# Altium schematic sheet ADC.SchDoc: 07 - Aquisicao do fotodetector e monitores
size A3; Project: CM5 Photonic Bias Controller; DocumentRev: R5; ProjectRev: R5; Version: Rev R6; SheetNumber: 8; SheetTotal: 17; Author: Carlos Renan; SCH_SCALE: N/A; Address1: UFCG; Address2: Referencia: VIRTUS CC; Address3: Campina Grande - PB; ProjectName: Controle automatico de BIAS para MZM/IQ - Projeto 3; DocumentName: ADC.SchDoc
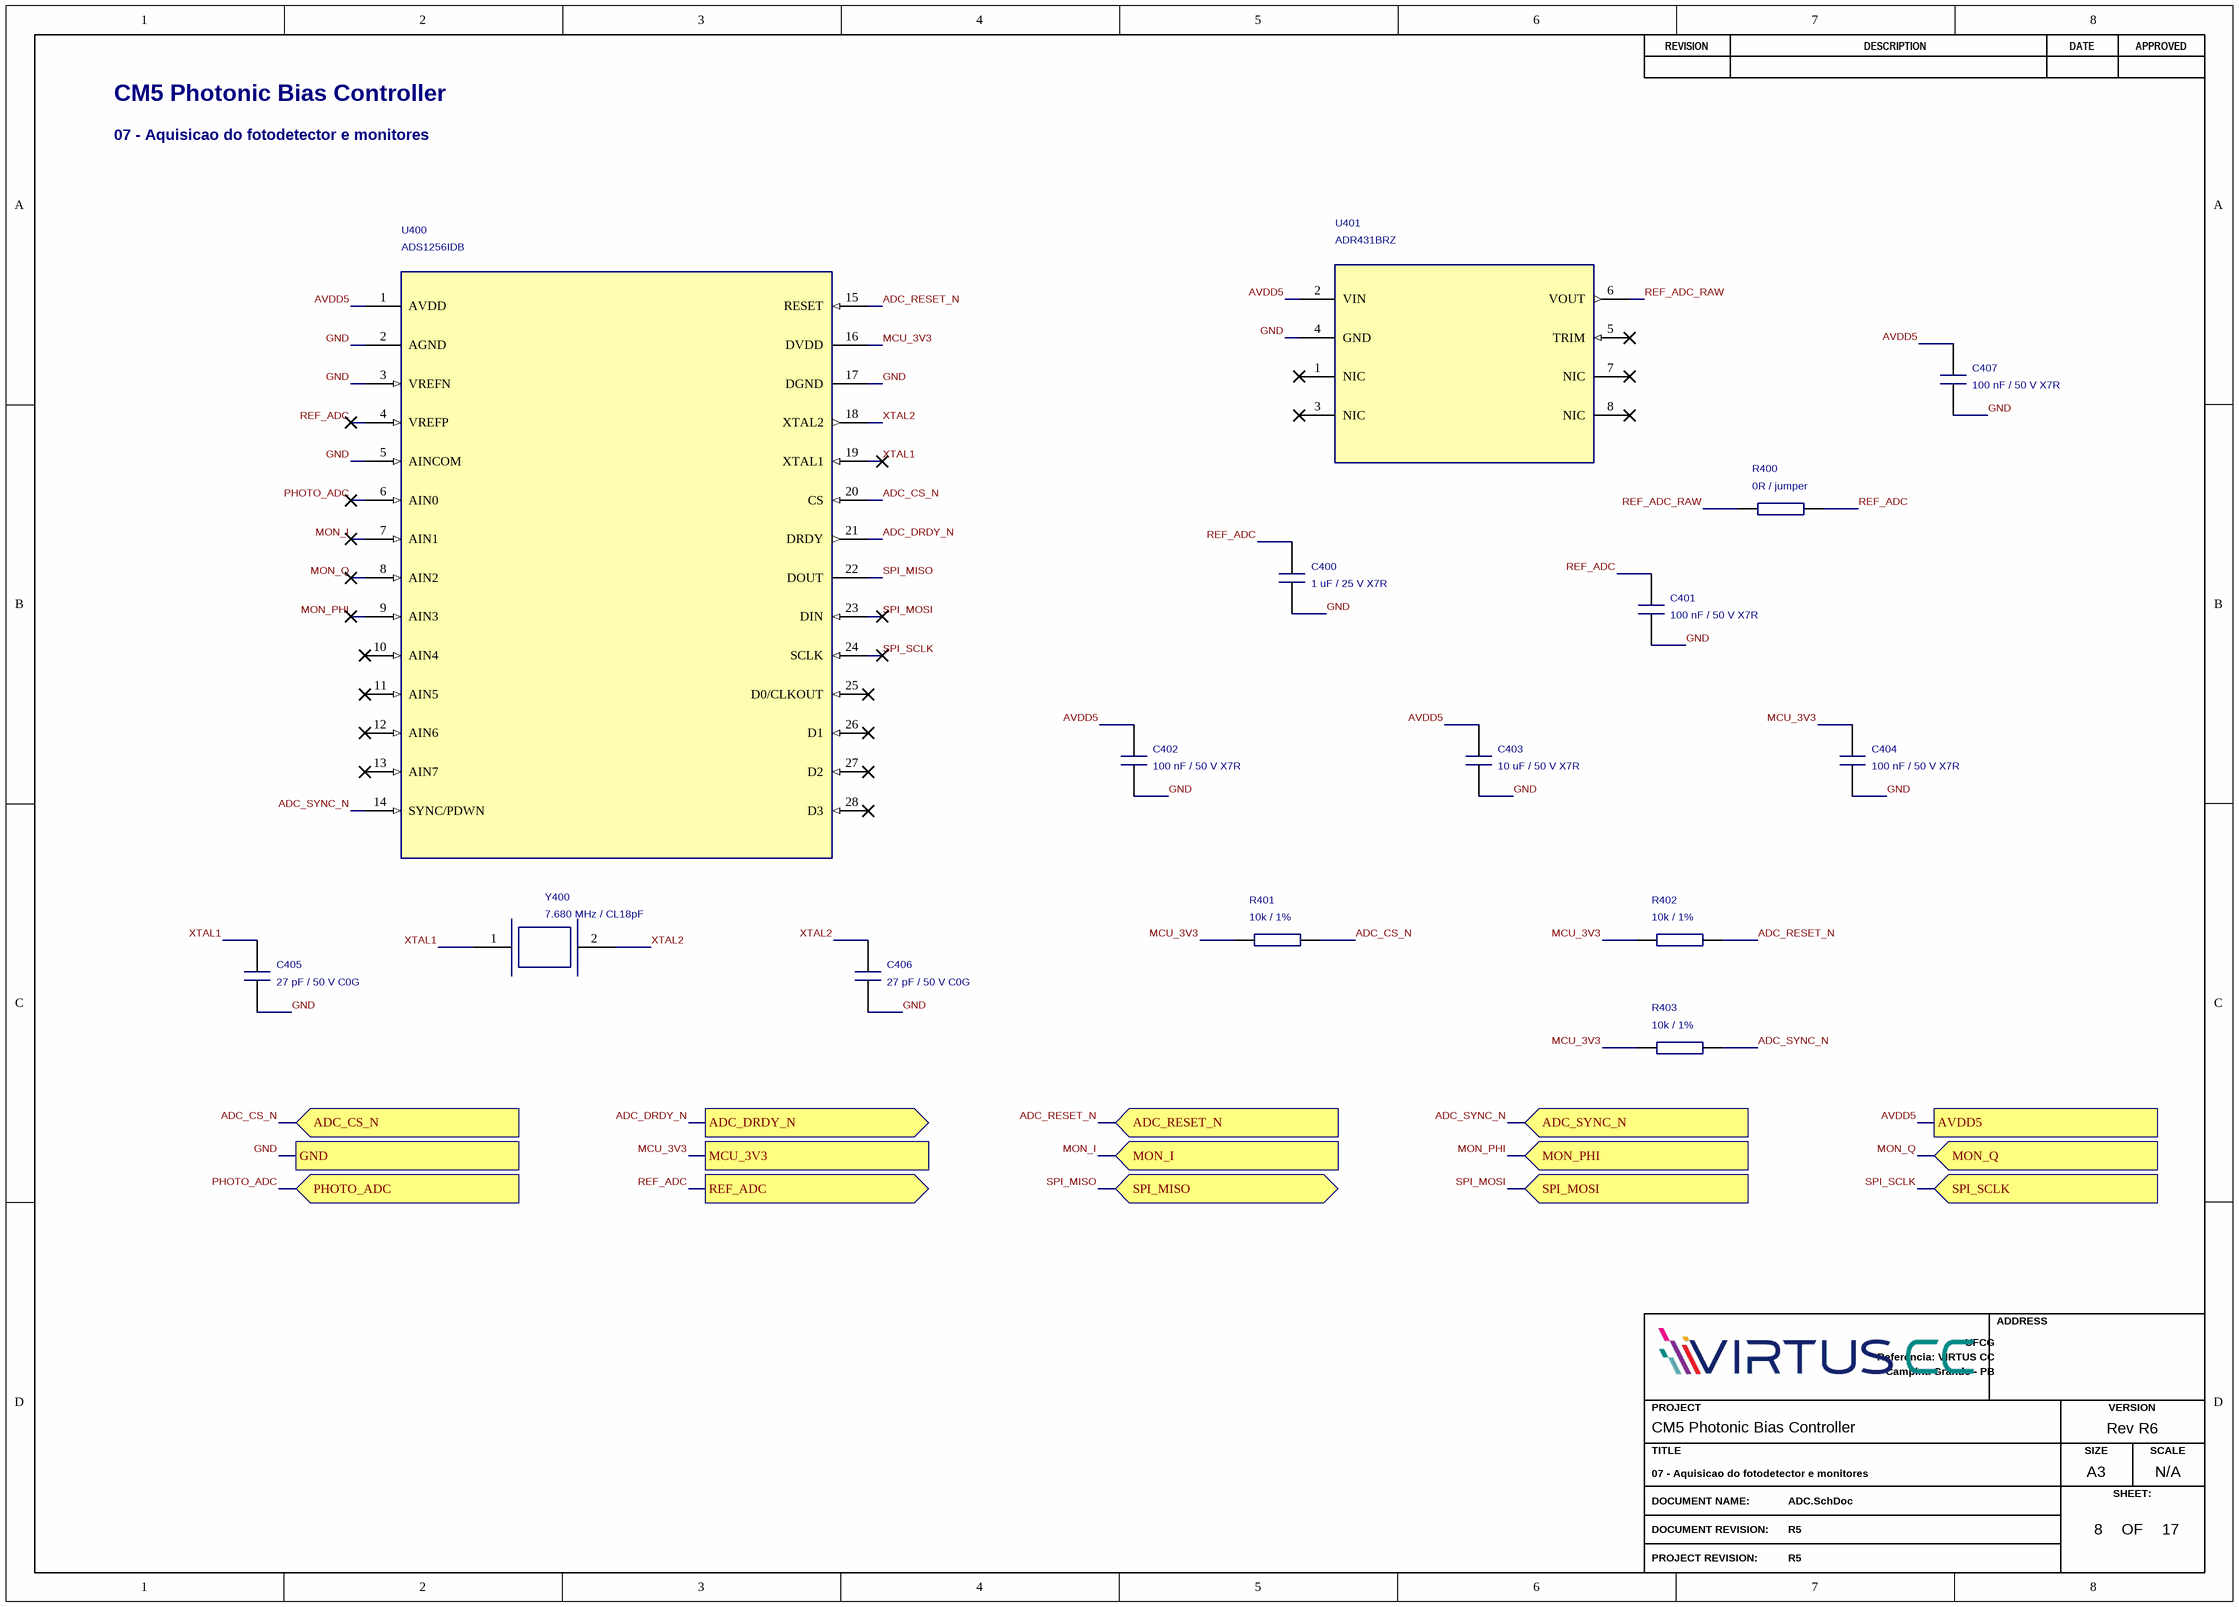
[diagram p0: ADC.SchDoc]

## Parts
C400  1 uF / 25 V X7R  [C0805]
C401  100 nF / 50 V X7R  [C0805]
C402  100 nF / 50 V X7R  [C0805]
C403  10 uF / 50 V X7R  [C1210]
C404  100 nF / 50 V X7R  [C0805]
C405  27 pF / 50 V C0G  [C0805]
C406  27 pF / 50 V C0G  [C0805]
C407  100 nF / 50 V X7R  [C0805]
R400  0R / jumper  [R-0603]
R401  10k / 1%  [R-0603]
R402  10k / 1%  [R-0603]
R403  10k / 1%  [R-0603]
U400  ADS1256IDB  [SSOP28_DB]
U401  ADR431BRZ  [SOIC8]
Y400  7.680 MHz / CL18pF  [XTAL_HC49]

## Ports
ADC_CS_N (in), ADC_DRDY_N (out), ADC_RESET_N (in), ADC_SYNC_N (in), AVDD5, GND, MCU_3V3, MON_I (in), MON_PHI (in), MON_Q (in), PHOTO_ADC (in), REF_ADC (out), SPI_MISO (bidir), SPI_MOSI (in), SPI_SCLK (in)

## Nets
ADC_CS_N: R401.2 U400.20(CS) ; port ADC_CS_N
ADC_DRDY_N: U400.21(DRDY) ; port ADC_DRDY_N
ADC_RESET_N: R402.2 U400.15(RESET) ; port ADC_RESET_N
ADC_SYNC_N: R403.2 U400.14(SYNC/PDWN) ; port ADC_SYNC_N
AVDD5: C402.1 C403.1 C407.1 U400.1(AVDD) U401.2(VIN) ; port AVDD5
GND: C400.2 C401.2 C402.2 C403.2 C404.2 C405.2 C406.2 C407.2 U400.2(AGND) U400.3(VREFN) U400.5(AINCOM) U400.17(DGND) U401.4(GND) ; port GND
MCU_3V3: C404.1 R401.1 R402.1 R403.1 U400.16(DVDD) ; port MCU_3V3
MON_I: U400.7(AIN1) ; port MON_I
MON_PHI: U400.9(AIN3) ; port MON_PHI
MON_Q: U400.8(AIN2) ; port MON_Q
PHOTO_ADC: U400.6(AIN0) ; port PHOTO_ADC
REF_ADC: C400.1 C401.1 R400.2 U400.4(VREFP) ; port REF_ADC
REF_ADC_RAW: R400.1 U401.6(VOUT)
SPI_MISO: U400.22(DOUT) ; port SPI_MISO
SPI_MOSI: U400.23(DIN) ; port SPI_MOSI
SPI_SCLK: U400.24(SCLK) ; port SPI_SCLK
XTAL1: C405.1 U400.19(XTAL1) Y400.1
XTAL2: C406.1 U400.18(XTAL2) Y400.2

Not connected (* = marked no-connect by the designer): U400 10(AIN4)* 11(AIN5)* 12(AIN6)* 13(AIN7)* 25(D0/CLKOUT)* 26(D1)* 27(D2)* 28(D3)*; U401 1(NIC)* 3(NIC)* 5(TRIM)* 7(NIC)* 8(NIC)*

## Notes on the sheet
- CM5 Photonic Bias Controller
- 07 - Aquisicao do fotodetector e monitores
- REVISION
- DESCRIPTION
- DATE
- APPROVED
- ADDRESS
- PROJECT
- VERSION
- TITLE
- A3
- SIZE
- SCALE
- DOCUMENT NAME:
- DOCUMENT REVISION:
- OF
- SHEET:
- PROJECT REVISION:

## Library data of the parts
C400 = 1 uF: Manufacturer: KEMET; Manufacturer Part Number: C0805C105K3RACTU; Procurement Status: Busca por MPN; SKU e disponibilidade a confirmar; BOM Purchase: Yes; Manufacturer 1: KEMET; Manufacturer Part Number 1: C0805C105K3RACTU; Supplier 1: DigiKey; Supplier URL 1: https://www.digikey.com.br/pt/products/result?keywords=C0805C105K3RACTU; Supplier 2: Mouser; Supplier URL 2: https://br.mouser.com/c/?q=C0805C105K3RACTU; Datasheet: https://www.yageogroup.com/download/specsheet/C0805C105K3RACTU
C401 C402 C404 C407 = 100 nF: Manufacturer: KEMET; Manufacturer Part Number: C0805C104K5RACTU; Procurement Status: Busca por MPN; SKU e disponibilidade a confirmar; BOM Purchase: Yes; Manufacturer 1: KEMET; Manufacturer Part Number 1: C0805C104K5RACTU; Supplier 1: DigiKey; Supplier URL 1: https://www.digikey.com.br/pt/products/result?keywords=C0805C104K5RACTU; Supplier 2: Mouser; Supplier URL 2: https://br.mouser.com/c/?q=C0805C104K5RACTU; Datasheet: https://www.yageogroup.com/download/specsheet/C0805C104K5RACTU
C403 = 10 uF: Manufacturer: KEMET; Manufacturer Part Number: C1210C106K5RACTU; Procurement Status: Busca por MPN; SKU e disponibilidade a confirmar; BOM Purchase: Yes; Manufacturer 1: KEMET; Manufacturer Part Number 1: C1210C106K5RACTU; Supplier 1: DigiKey; Supplier URL 1: https://www.digikey.com.br/pt/products/result?keywords=C1210C106K5RACTU; Supplier 2: Mouser; Supplier URL 2: https://br.mouser.com/c/?q=C1210C106K5RACTU; Datasheet: https://www.yageogroup.com/download/specsheet/C1210C106K5RACTU
C405 C406 = 27 pF: Manufacturer: KEMET; Manufacturer Part Number: C0805C270J5GACTU; Procurement Status: Busca por MPN; SKU e disponibilidade a confirmar; BOM Purchase: Yes; Manufacturer 1: KEMET; Manufacturer Part Number 1: C0805C270J5GACTU; Supplier 1: DigiKey; Supplier URL 1: https://www.digikey.com.br/pt/products/result?keywords=C0805C270J5GACTU; Supplier 2: Mouser; Supplier URL 2: https://br.mouser.com/c/?q=C0805C270J5GACTU; Datasheet: https://www.yageogroup.com/download/specsheet/C0805C270J5GACTU
R400 = 0R: Manufacturer: YAGEO; Manufacturer Part Number: RC0603JR-070RL; Procurement Status: Busca por MPN; SKU e disponibilidade a confirmar; BOM Purchase: Yes; Manufacturer 1: YAGEO; Manufacturer Part Number 1: RC0603JR-070RL; Supplier 1: DigiKey; Supplier URL 1: https://www.digikey.com.br/pt/products/result?keywords=RC0603JR-070RL; Supplier 2: Mouser; Supplier URL 2: https://br.mouser.com/c/?q=RC0603JR-070RL; Datasheet: https://www.yageo.com/en/Product/Index/rchip
R401-R403 = 10k: Manufacturer: YAGEO; Manufacturer Part Number: RC0603FR-0710KL; Procurement Status: Busca por MPN; SKU e disponibilidade a confirmar; BOM Purchase: Yes; Manufacturer 1: YAGEO; Manufacturer Part Number 1: RC0603FR-0710KL; Supplier 1: DigiKey; Supplier URL 1: https://www.digikey.com.br/pt/products/result?keywords=RC0603FR-0710KL; Supplier 2: Mouser; Supplier URL 2: https://br.mouser.com/c/?q=RC0603FR-0710KL; Datasheet: https://www.yageo.com/en/Product/Index/rchip
U400 = ADS1256IDB: Manufacturer: Texas Instruments; Procurement Status: Busca por MPN; SKU e disponibilidade a confirmar; BOM Purchase: Yes; Manufacturer Part Number: ADS1256IDB; Manufacturer 1: Texas Instruments; Manufacturer Part Number 1: ADS1256IDB; Supplier 1: DigiKey; Supplier URL 1: https://www.digikey.com.br/pt/products/result?keywords=ADS1256IDB; Supplier 2: Mouser; Supplier URL 2: https://br.mouser.com/c/?q=ADS1256IDB; Datasheet: https://www.ti.com/lit/ds/symlink/ads1256.pdf
U401 = ADR431BRZ: Manufacturer: Analog Devices; Procurement Status: Busca por MPN; SKU e disponibilidade a confirmar; BOM Purchase: Yes; Manufacturer Part Number: ADR431BRZ; Manufacturer 1: Analog Devices; Manufacturer Part Number 1: ADR431BRZ; Supplier 1: DigiKey; Supplier URL 1: https://www.digikey.com.br/pt/products/result?keywords=ADR431BRZ; Supplier 2: Mouser; Supplier URL 2: https://br.mouser.com/c/?q=ADR431BRZ; Datasheet: https://www.analog.com/media/en/technical-documentation/data-sheets/ADR430_431_433_434_435.pdf
Y400 = 7.680 MHz: Manufacturer: Abracon; Manufacturer Part Number: ABLS-7.680MHZ-B2-T; Review: CL 18 pF; 27 pF externos sao iniciais. Ajustar aos parasitas e verificar oscilacao.; Procurement Status: Busca por MPN; SKU e disponibilidade a confirmar; BOM Purchase: Yes; Manufacturer 1: Abracon; Manufacturer Part Number 1: ABLS-7.680MHZ-B2-T; Supplier 1: DigiKey; Supplier URL 1: https://www.digikey.com.br/pt/products/result?keywords=ABLS-7.680MHZ-B2-T; Supplier 2: Mouser; Supplier URL 2: https://br.mouser.com/c/?q=ABLS-7.680MHZ-B2-T; Datasheet: https://abracon.com/Resonators/abls.pdf